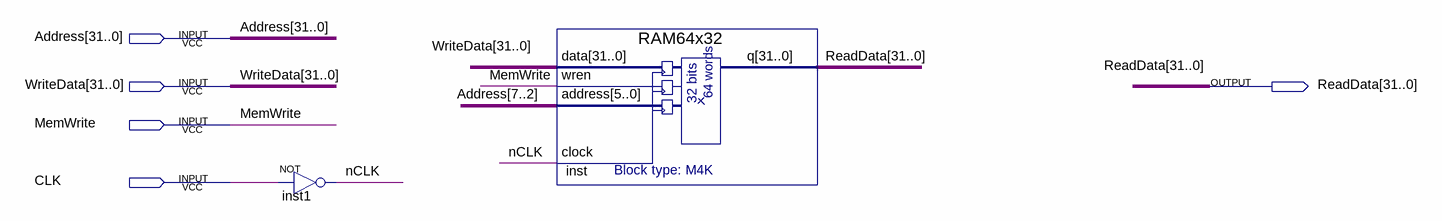
[diagram p0: schematic sheet]
// Quartus schematic DMem.bdf as structural Verilog: 2 symbols, 5 pins
module DMem (
  input  [31:0] Address,
  input  [31:0] WriteData,
  input  MemWrite,
  input  CLK,
  output [31:0] ReadData
);

  wire nCLK;

  not inst1 (nCLK, CLK);
  RAM64x32 inst (.data(WriteData), .wren(MemWrite), .address(Address[7:2]), .clock(nCLK), .q(ReadData));
endmodule
